# Altium schematic sheet ModuMIDI_Keys.SchDoc
size A; SheetNumber: 1; SheetTotal: 3
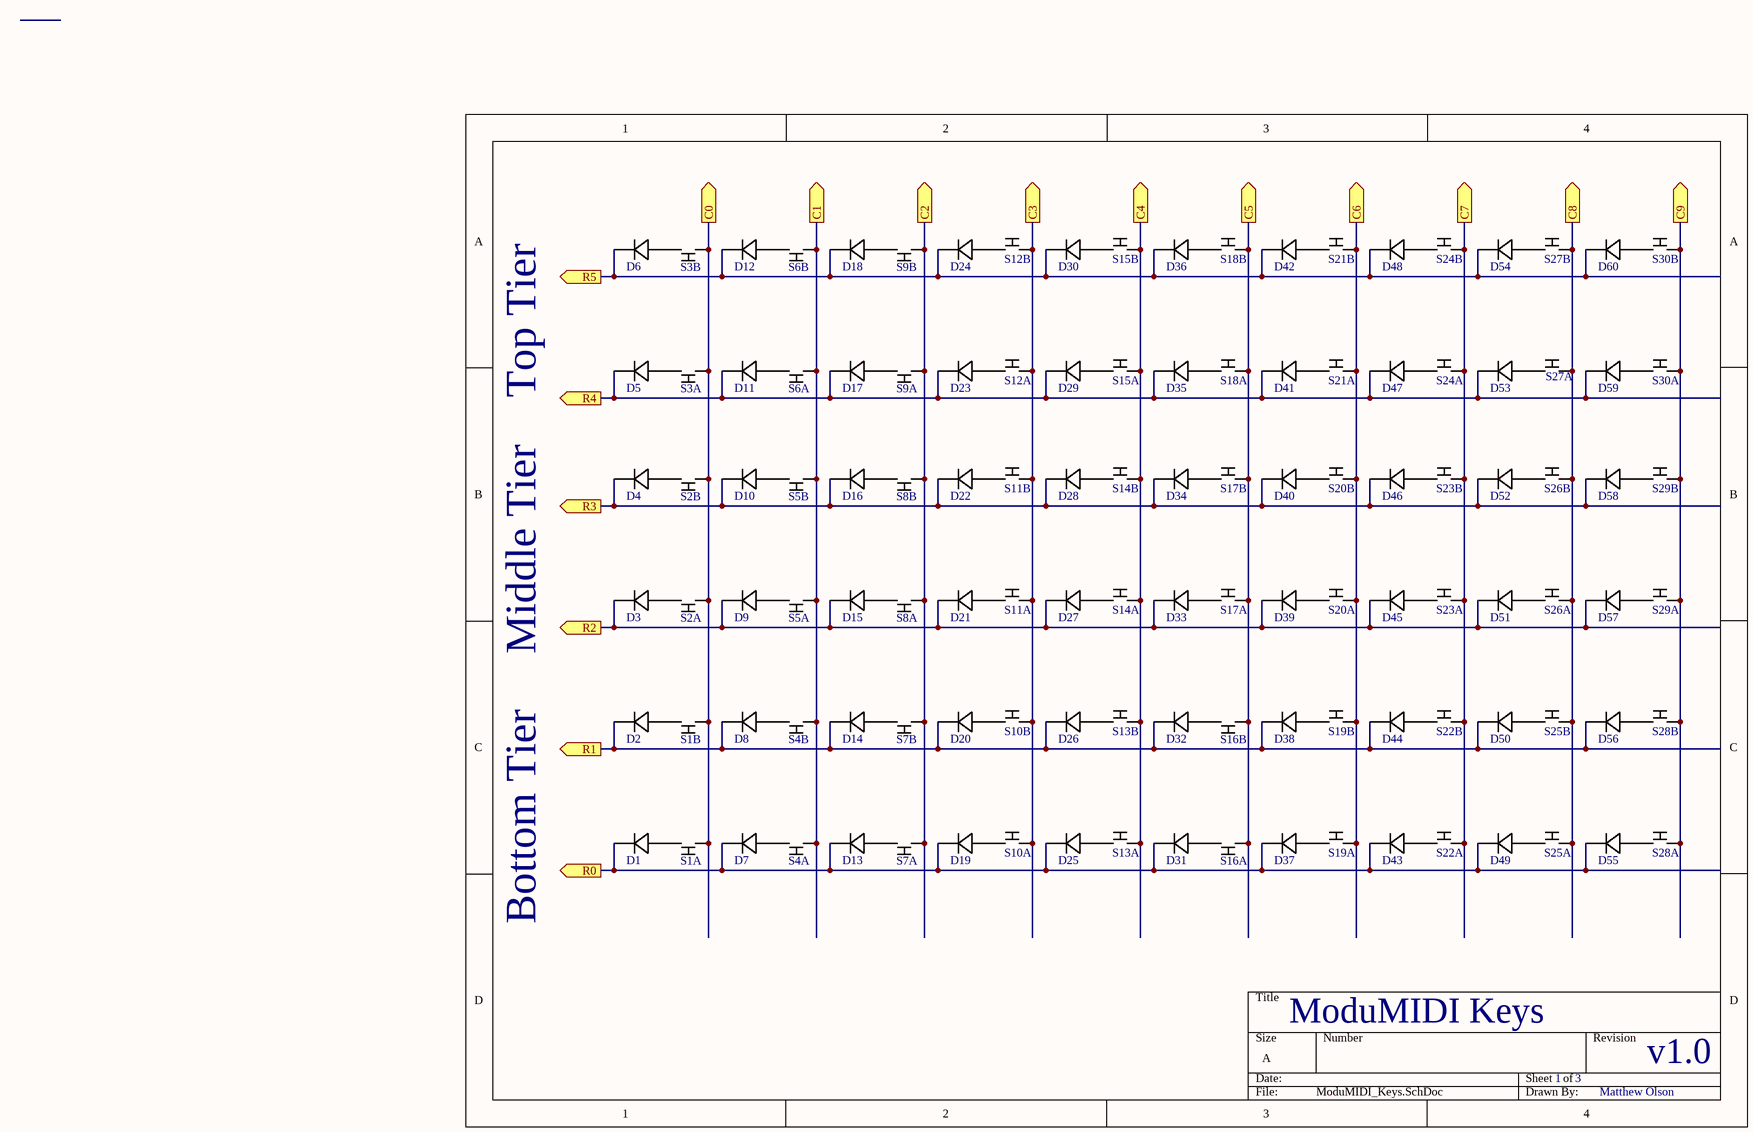
[diagram p0: ModuMIDI_Keys.SchDoc]

## Parts
D1  1N4148-T26A  [DIODE_ZDO_DO-35_ONS]  (value not drawn)
D2  1N4148-T26A  [DIODE_ZDO_DO-35_ONS]  (value not drawn)
D3  1N4148-T26A  [DIODE_ZDO_DO-35_ONS]  (value not drawn)
D4  1N4148-T26A  [DIODE_ZDO_DO-35_ONS]  (value not drawn)
D5  1N4148-T26A  [DIODE_ZDO_DO-35_ONS]  (value not drawn)
D6  1N4148-T26A  [DIODE_ZDO_DO-35_ONS]  (value not drawn)
D7  1N4148-T26A  [DIODE_ZDO_DO-35_ONS]  (value not drawn)
D8  1N4148-T26A  [DIODE_ZDO_DO-35_ONS]  (value not drawn)
D9  1N4148-T26A  [DIODE_ZDO_DO-35_ONS]  (value not drawn)
D10  1N4148-T26A  [DIODE_ZDO_DO-35_ONS]  (value not drawn)
D11  1N4148-T26A  [DIODE_ZDO_DO-35_ONS]  (value not drawn)
D12  1N4148-T26A  [DIODE_ZDO_DO-35_ONS]  (value not drawn)
D13  1N4148-T26A  [DIODE_ZDO_DO-35_ONS]  (value not drawn)
D14  1N4148-T26A  [DIODE_ZDO_DO-35_ONS]  (value not drawn)
D15  1N4148-T26A  [DIODE_ZDO_DO-35_ONS]  (value not drawn)
D16  1N4148-T26A  [DIODE_ZDO_DO-35_ONS]  (value not drawn)
D17  1N4148-T26A  [DIODE_ZDO_DO-35_ONS]  (value not drawn)
D18  1N4148-T26A  [DIODE_ZDO_DO-35_ONS]  (value not drawn)
D19  1N4148-T26A  [DIODE_ZDO_DO-35_ONS]  (value not drawn)
D20  1N4148-T26A  [DIODE_ZDO_DO-35_ONS]  (value not drawn)
D21  1N4148-T26A  [DIODE_ZDO_DO-35_ONS]  (value not drawn)
D22  1N4148-T26A  [DIODE_ZDO_DO-35_ONS]  (value not drawn)
D23  1N4148-T26A  [DIODE_ZDO_DO-35_ONS]  (value not drawn)
D24  1N4148-T26A  [DIODE_ZDO_DO-35_ONS]  (value not drawn)
D25  1N4148-T26A  [DIODE_ZDO_DO-35_ONS]  (value not drawn)
D26  1N4148-T26A  [DIODE_ZDO_DO-35_ONS]  (value not drawn)
D27  1N4148-T26A  [DIODE_ZDO_DO-35_ONS]  (value not drawn)
D28  1N4148-T26A  [DIODE_ZDO_DO-35_ONS]  (value not drawn)
D29  1N4148-T26A  [DIODE_ZDO_DO-35_ONS]  (value not drawn)
D30  1N4148-T26A  [DIODE_ZDO_DO-35_ONS]  (value not drawn)
D31  1N4148-T26A  [DIODE_ZDO_DO-35_ONS]  (value not drawn)
D32  1N4148-T26A  [DIODE_ZDO_DO-35_ONS]  (value not drawn)
D33  1N4148-T26A  [DIODE_ZDO_DO-35_ONS]  (value not drawn)
D34  1N4148-T26A  [DIODE_ZDO_DO-35_ONS]  (value not drawn)
D35  1N4148-T26A  [DIODE_ZDO_DO-35_ONS]  (value not drawn)
D36  1N4148-T26A  [DIODE_ZDO_DO-35_ONS]  (value not drawn)
D37  1N4148-T26A  [DIODE_ZDO_DO-35_ONS]  (value not drawn)
D38  1N4148-T26A  [DIODE_ZDO_DO-35_ONS]  (value not drawn)
D39  1N4148-T26A  [DIODE_ZDO_DO-35_ONS]  (value not drawn)
D40  1N4148-T26A  [DIODE_ZDO_DO-35_ONS]  (value not drawn)
D41  1N4148-T26A  [DIODE_ZDO_DO-35_ONS]  (value not drawn)
D42  1N4148-T26A  [DIODE_ZDO_DO-35_ONS]  (value not drawn)
D43  1N4148-T26A  [DIODE_ZDO_DO-35_ONS]  (value not drawn)
D44  1N4148-T26A  [DIODE_ZDO_DO-35_ONS]  (value not drawn)
D45  1N4148-T26A  [DIODE_ZDO_DO-35_ONS]  (value not drawn)
D46  1N4148-T26A  [DIODE_ZDO_DO-35_ONS]  (value not drawn)
D47  1N4148-T26A  [DIODE_ZDO_DO-35_ONS]  (value not drawn)
D48  1N4148-T26A  [DIODE_ZDO_DO-35_ONS]  (value not drawn)
D49  1N4148-T26A  [DIODE_ZDO_DO-35_ONS]  (value not drawn)
D50  1N4148-T26A  [DIODE_ZDO_DO-35_ONS]  (value not drawn)
D51  1N4148-T26A  [DIODE_ZDO_DO-35_ONS]  (value not drawn)
D52  1N4148-T26A  [DIODE_ZDO_DO-35_ONS]  (value not drawn)
D53  1N4148-T26A  [DIODE_ZDO_DO-35_ONS]  (value not drawn)
D54  1N4148-T26A  [DIODE_ZDO_DO-35_ONS]  (value not drawn)
D55  1N4148-T26A  [DIODE_ZDO_DO-35_ONS]  (value not drawn)
D56  1N4148-T26A  [DIODE_ZDO_DO-35_ONS]  (value not drawn)
D57  1N4148-T26A  [DIODE_ZDO_DO-35_ONS]  (value not drawn)
D58  1N4148-T26A  [DIODE_ZDO_DO-35_ONS]  (value not drawn)
D59  1N4148-T26A  [DIODE_ZDO_DO-35_ONS]  (value not drawn)
D60  1N4148-T26A  [DIODE_ZDO_DO-35_ONS]  (value not drawn)
S1  Button_Symbol  [ModuMIDI_Button_Footprint]  (value not drawn)  (parts A,B of 2)
S2  Button_Symbol  [ModuMIDI_Button_Footprint]  (value not drawn)  (parts A,B of 2)
S3  Button_Symbol  [ModuMIDI_Button_Footprint]  (value not drawn)  (parts A,B of 2)
S4  Button_Symbol  [ModuMIDI_Button_Footprint]  (value not drawn)  (parts A,B of 2)
S5  Button_Symbol  [ModuMIDI_Button_Footprint]  (value not drawn)  (parts A,B of 2)
S6  Button_Symbol  [ModuMIDI_Button_Footprint]  (value not drawn)  (parts A,B of 2)
S7  Button_Symbol  [ModuMIDI_Button_Footprint]  (value not drawn)  (parts A,B of 2)
S8  Button_Symbol  [ModuMIDI_Button_Footprint]  (value not drawn)  (parts A,B of 2)
S9  Button_Symbol  [ModuMIDI_Button_Footprint]  (value not drawn)  (parts A,B of 2)
S10  Button_Symbol  [ModuMIDI_Button_Footprint]  (value not drawn)  (parts A,B of 2)
S11  Button_Symbol  [ModuMIDI_Button_Footprint]  (value not drawn)  (parts A,B of 2)
S12  Button_Symbol  [ModuMIDI_Button_Footprint]  (value not drawn)  (parts A,B of 2)
S13  Button_Symbol  [ModuMIDI_Button_Footprint]  (value not drawn)  (parts A,B of 2)
S14  Button_Symbol  [ModuMIDI_Button_Footprint]  (value not drawn)  (parts A,B of 2)
S15  Button_Symbol  [ModuMIDI_Button_Footprint]  (value not drawn)  (parts A,B of 2)
S16  Button_Symbol  [ModuMIDI_Button_Footprint]  (value not drawn)  (parts A,B of 2)
S17  Button_Symbol  [ModuMIDI_Button_Footprint]  (value not drawn)  (parts A,B of 2)
S18  Button_Symbol  [ModuMIDI_Button_Footprint]  (value not drawn)  (parts A,B of 2)
S19  Button_Symbol  [ModuMIDI_Button_Footprint]  (value not drawn)  (parts A,B of 2)
S20  Button_Symbol  [ModuMIDI_Button_Footprint]  (value not drawn)  (parts A,B of 2)
S21  Button_Symbol  [ModuMIDI_Button_Footprint]  (value not drawn)  (parts A,B of 2)
S22  Button_Symbol  [ModuMIDI_Button_Footprint]  (value not drawn)  (parts A,B of 2)
S23  Button_Symbol  [ModuMIDI_Button_Footprint]  (value not drawn)  (parts A,B of 2)
S24  Button_Symbol  [ModuMIDI_Button_Footprint]  (value not drawn)  (parts A,B of 2)
S25  Button_Symbol  [ModuMIDI_Button_Footprint]  (value not drawn)  (parts A,B of 2)
S26  Button_Symbol  [ModuMIDI_Button_Footprint]  (value not drawn)  (parts A,B of 2)
S27  Button_Symbol  [ModuMIDI_Button_Footprint]  (value not drawn)  (parts A,B of 2)
S28  Button_Symbol  [ModuMIDI_Button_Footprint]  (value not drawn)  (parts A,B of 2)
S29  Button_Symbol  [ModuMIDI_Button_Footprint]  (value not drawn)  (parts A,B of 2)
S30  Button_Symbol  [ModuMIDI_Button_Footprint]  (value not drawn)  (parts A,B of 2)

## Ports
C0 (out), C1 (out), C2 (out), C3 (out), C4 (out), C5 (out), C6 (out), C7 (out), C8 (out), C9 (out), R0 (out), R1 (out), R2 (out), R3 (out), R4 (out), R5 (out)

## Nets
C0: S1.1 S1.3 S2.1 S2.3 S3.1 S3.3 ; port C0
C1: S4.1 S4.3 S5.1 S5.3 S6.1 S6.3 ; port C1
C2: S7.1 S7.3 S8.1 S8.3 S9.1 S9.3 ; port C2
C3: S10.1 S10.3 S11.1 S11.3 S12.1 S12.3 ; port C3
C4: S13.1 S13.3 S14.1 S14.3 S15.1 S15.3 ; port C4
C5: S16.1 S16.3 S17.1 S17.3 S18.1 S18.3 ; port C5
C6: S19.1 S19.3 S20.1 S20.3 S21.1 S21.3 ; port C6
C7: S22.1 S22.3 S23.1 S23.3 S24.1 S24.3 ; port C7
C8: S25.1 S25.3 S26.1 S26.3 S27.1 S27.3 ; port C8
C9: S28.1 S28.3 S29.1 S29.3 S30.1 S30.3 ; port C9
R0: D1.1 D7.1 D13.1 D19.1 D25.1 D31.1 D37.1 D43.1 D49.1 D55.1 ; port R0
R1: D2.1 D8.1 D14.1 D20.1 D26.1 D32.1 D38.1 D44.1 D50.1 D56.1 ; port R1
R2: D3.1 D9.1 D15.1 D21.1 D27.1 D33.1 D39.1 D45.1 D51.1 D57.1 ; port R2
R3: D4.1 D10.1 D16.1 D22.1 D28.1 D34.1 D40.1 D46.1 D52.1 D58.1 ; port R3
R4: D5.1 D11.1 D17.1 D23.1 D29.1 D35.1 D41.1 D47.1 D53.1 D59.1 ; port R4
R5: D6.1 D12.1 D18.1 D24.1 D30.1 D36.1 D42.1 D48.1 D54.1 D60.1 ; port R5
NetD1_2: D1.2 S1.0
NetD2_2: D2.2 S1.2
NetD3_2: D3.2 S2.0
NetD4_2: D4.2 S2.2
NetD5_2: D5.2 S3.0
NetD6_2: D6.2 S3.2
NetD7_2: D7.2 S4.0
NetD8_2: D8.2 S4.2
NetD9_2: D9.2 S5.0
NetD10_2: D10.2 S5.2
NetD11_2: D11.2 S6.0
NetD12_2: D12.2 S6.2
NetD13_2: D13.2 S7.0
NetD14_2: D14.2 S7.2
NetD15_2: D15.2 S8.0
NetD16_2: D16.2 S8.2
NetD17_2: D17.2 S9.0
NetD18_2: D18.2 S9.2
NetD19_2: D19.2 S10.0
NetD20_2: D20.2 S10.2
NetD21_2: D21.2 S11.0
NetD22_2: D22.2 S11.2
NetD23_2: D23.2 S12.0
NetD24_2: D24.2 S12.2
NetD25_2: D25.2 S13.0
NetD26_2: D26.2 S13.2
NetD27_2: D27.2 S14.0
NetD28_2: D28.2 S14.2
NetD29_2: D29.2 S15.0
NetD30_2: D30.2 S15.2
NetD31_2: D31.2 S16.0
NetD32_2: D32.2 S16.2
NetD33_2: D33.2 S17.0
NetD34_2: D34.2 S17.2
NetD35_2: D35.2 S18.0
NetD36_2: D36.2 S18.2
NetD37_2: D37.2 S19.0
NetD38_2: D38.2 S19.2
NetD39_2: D39.2 S20.0
NetD40_2: D40.2 S20.2
NetD41_2: D41.2 S21.0
NetD42_2: D42.2 S21.2
NetD43_2: D43.2 S22.0
NetD44_2: D44.2 S22.2
NetD45_2: D45.2 S23.0
NetD46_2: D46.2 S23.2
NetD47_2: D47.2 S24.0
NetD48_2: D48.2 S24.2
NetD49_2: D49.2 S25.0
NetD50_2: D50.2 S25.2
NetD51_2: D51.2 S26.0
NetD52_2: D52.2 S26.2
NetD53_2: D53.2 S27.0
NetD54_2: D54.2 S27.2
NetD55_2: D55.2 S28.0
NetD56_2: D56.2 S28.2
NetD57_2: D57.2 S29.0
NetD58_2: D58.2 S29.2
NetD59_2: D59.2 S30.0
NetD60_2: D60.2 S30.2

## Notes on the sheet
- Top Tier
- Middle Tier
- Bottom Tier
- ModuMIDI Keys
- 1
- 3
- v1.0
- Matthew Olson

## Library data of the parts
D1-D60 = 1N4148-T26A: DIODE GEN PURP 100V 200MA DO35; Mfr_Name: onsemi; Type: DEV; Copyright: Copyright (C) 2023 Ultra Librarian. All rights reserved.; PN: 1N4148-T26A; RefDes: RefDes
S1-S30 = Button_Symbol: Two button switches to match silicon buttons for keyboard